# Altium schematic sheet Sheet2.SchDoc
size A4
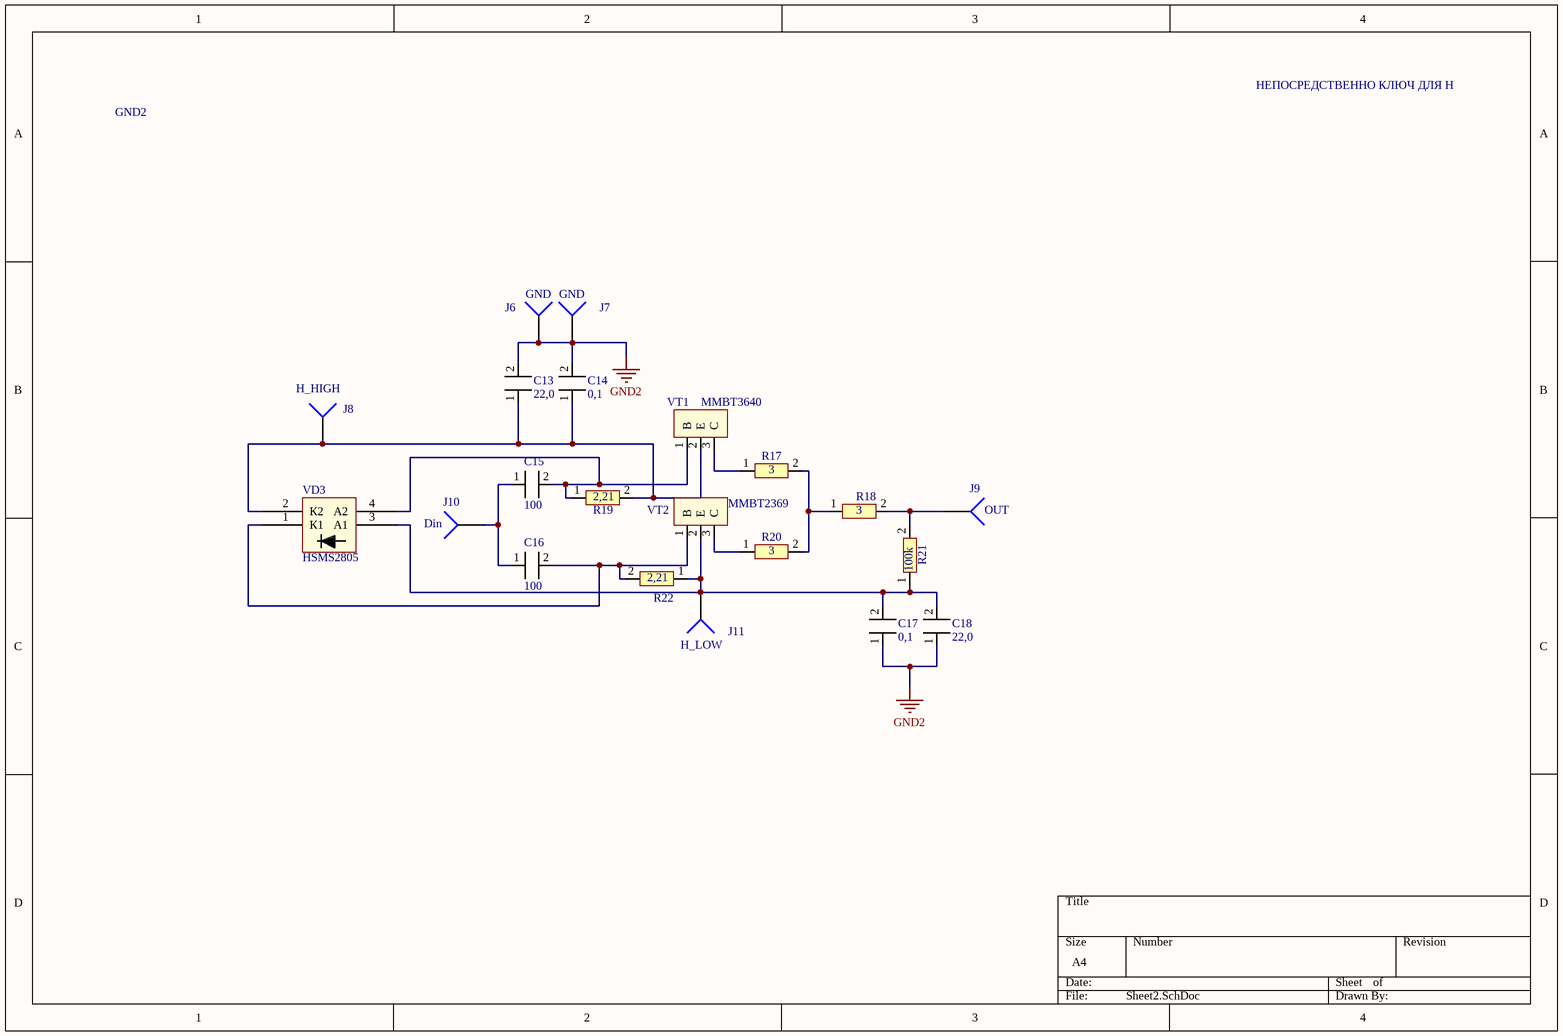
[diagram p0: Sheet2.SchDoc]

## Parts
C13  22,0  [Cap_BIG]
C14  0,1  [CAP_SMALL]
C15  100  [CAP_SMALL]
C16  100  [CAP_SMALL]
C17  0,1  [CAP_SMALL]
C18  22,0  [Cap_BIG]
J6  GND  [PIN1]
J7  GND  [PIN1]
J8  H_HIGH  [PIN1]
J9  OUT  [PIN1]
J10  Din  [PIN1]
J11  H_LOW  [PIN1]
R17  3  [RES]
R18  3  [RES]
R19  2,21  [RES]
R20  3  [RES]
R21  100k  [RES]
R22  2,21  [RES]
VD3  HSMS2805  [SOT-143B]
VT1  MMBT3640  [SOT23-BEC_MMBT3640*(Primary)]
VT2  MMBT2369  [SOT23-BEC_MMBT3640*(Primary)]

## Nets
GND2: C13.2 C14.2 C17.1 C18.1 J6.1 J7.1
NetC13_1: C13.1 C14.1 J8.1 R19.2 VD3.2(К2) VT1.2(E)
NetC15_1: C15.1 C16.1 J10.1
NetC15_2: C15.2 R19.1 VD3.4(А2) VT1.1(B)
NetC16_2: C16.2 R22.2 VD3.1(К1) VT2.1(B)
NetC17_2: C17.2 C18.2 J11.1 R21.1 R22.1 VD3.3(А1) VT2.2(E)
NetJ9_1: J9.1 R18.2 R21.2
NetR17_1: R17.1 VT1.3(C)
NetR17_2: R17.2 R18.1 R20.2
NetR20_1: R20.1 VT2.3(C)

## Notes on the sheet
- GND2
- НЕПОСРЕДСТВЕННО КЛЮЧ ДЛЯ H

## Library data of the parts
C13 C18 = CAP_BIG
C14-C17 = CAP_SMALL
J6-J11 = Socket: LatestRevisionDate: 17-Jul-2002; LatestRevisionNote: Re-released for DXP Platform.; Publisher: Altium Limited
R17-R22 = RES
VD3 = HSMS-2805